# EasyEDA Pro project 无线调试串口.epro

# Schematic schematic1
Create Date: 2024-03-17; Page Name: P1; Project Name: 无线串口; Schematic Name: Schematic1; Update Date: 2024-03-17; Company: 嘉立创EDA; Page Size: A4; Version: V1.0
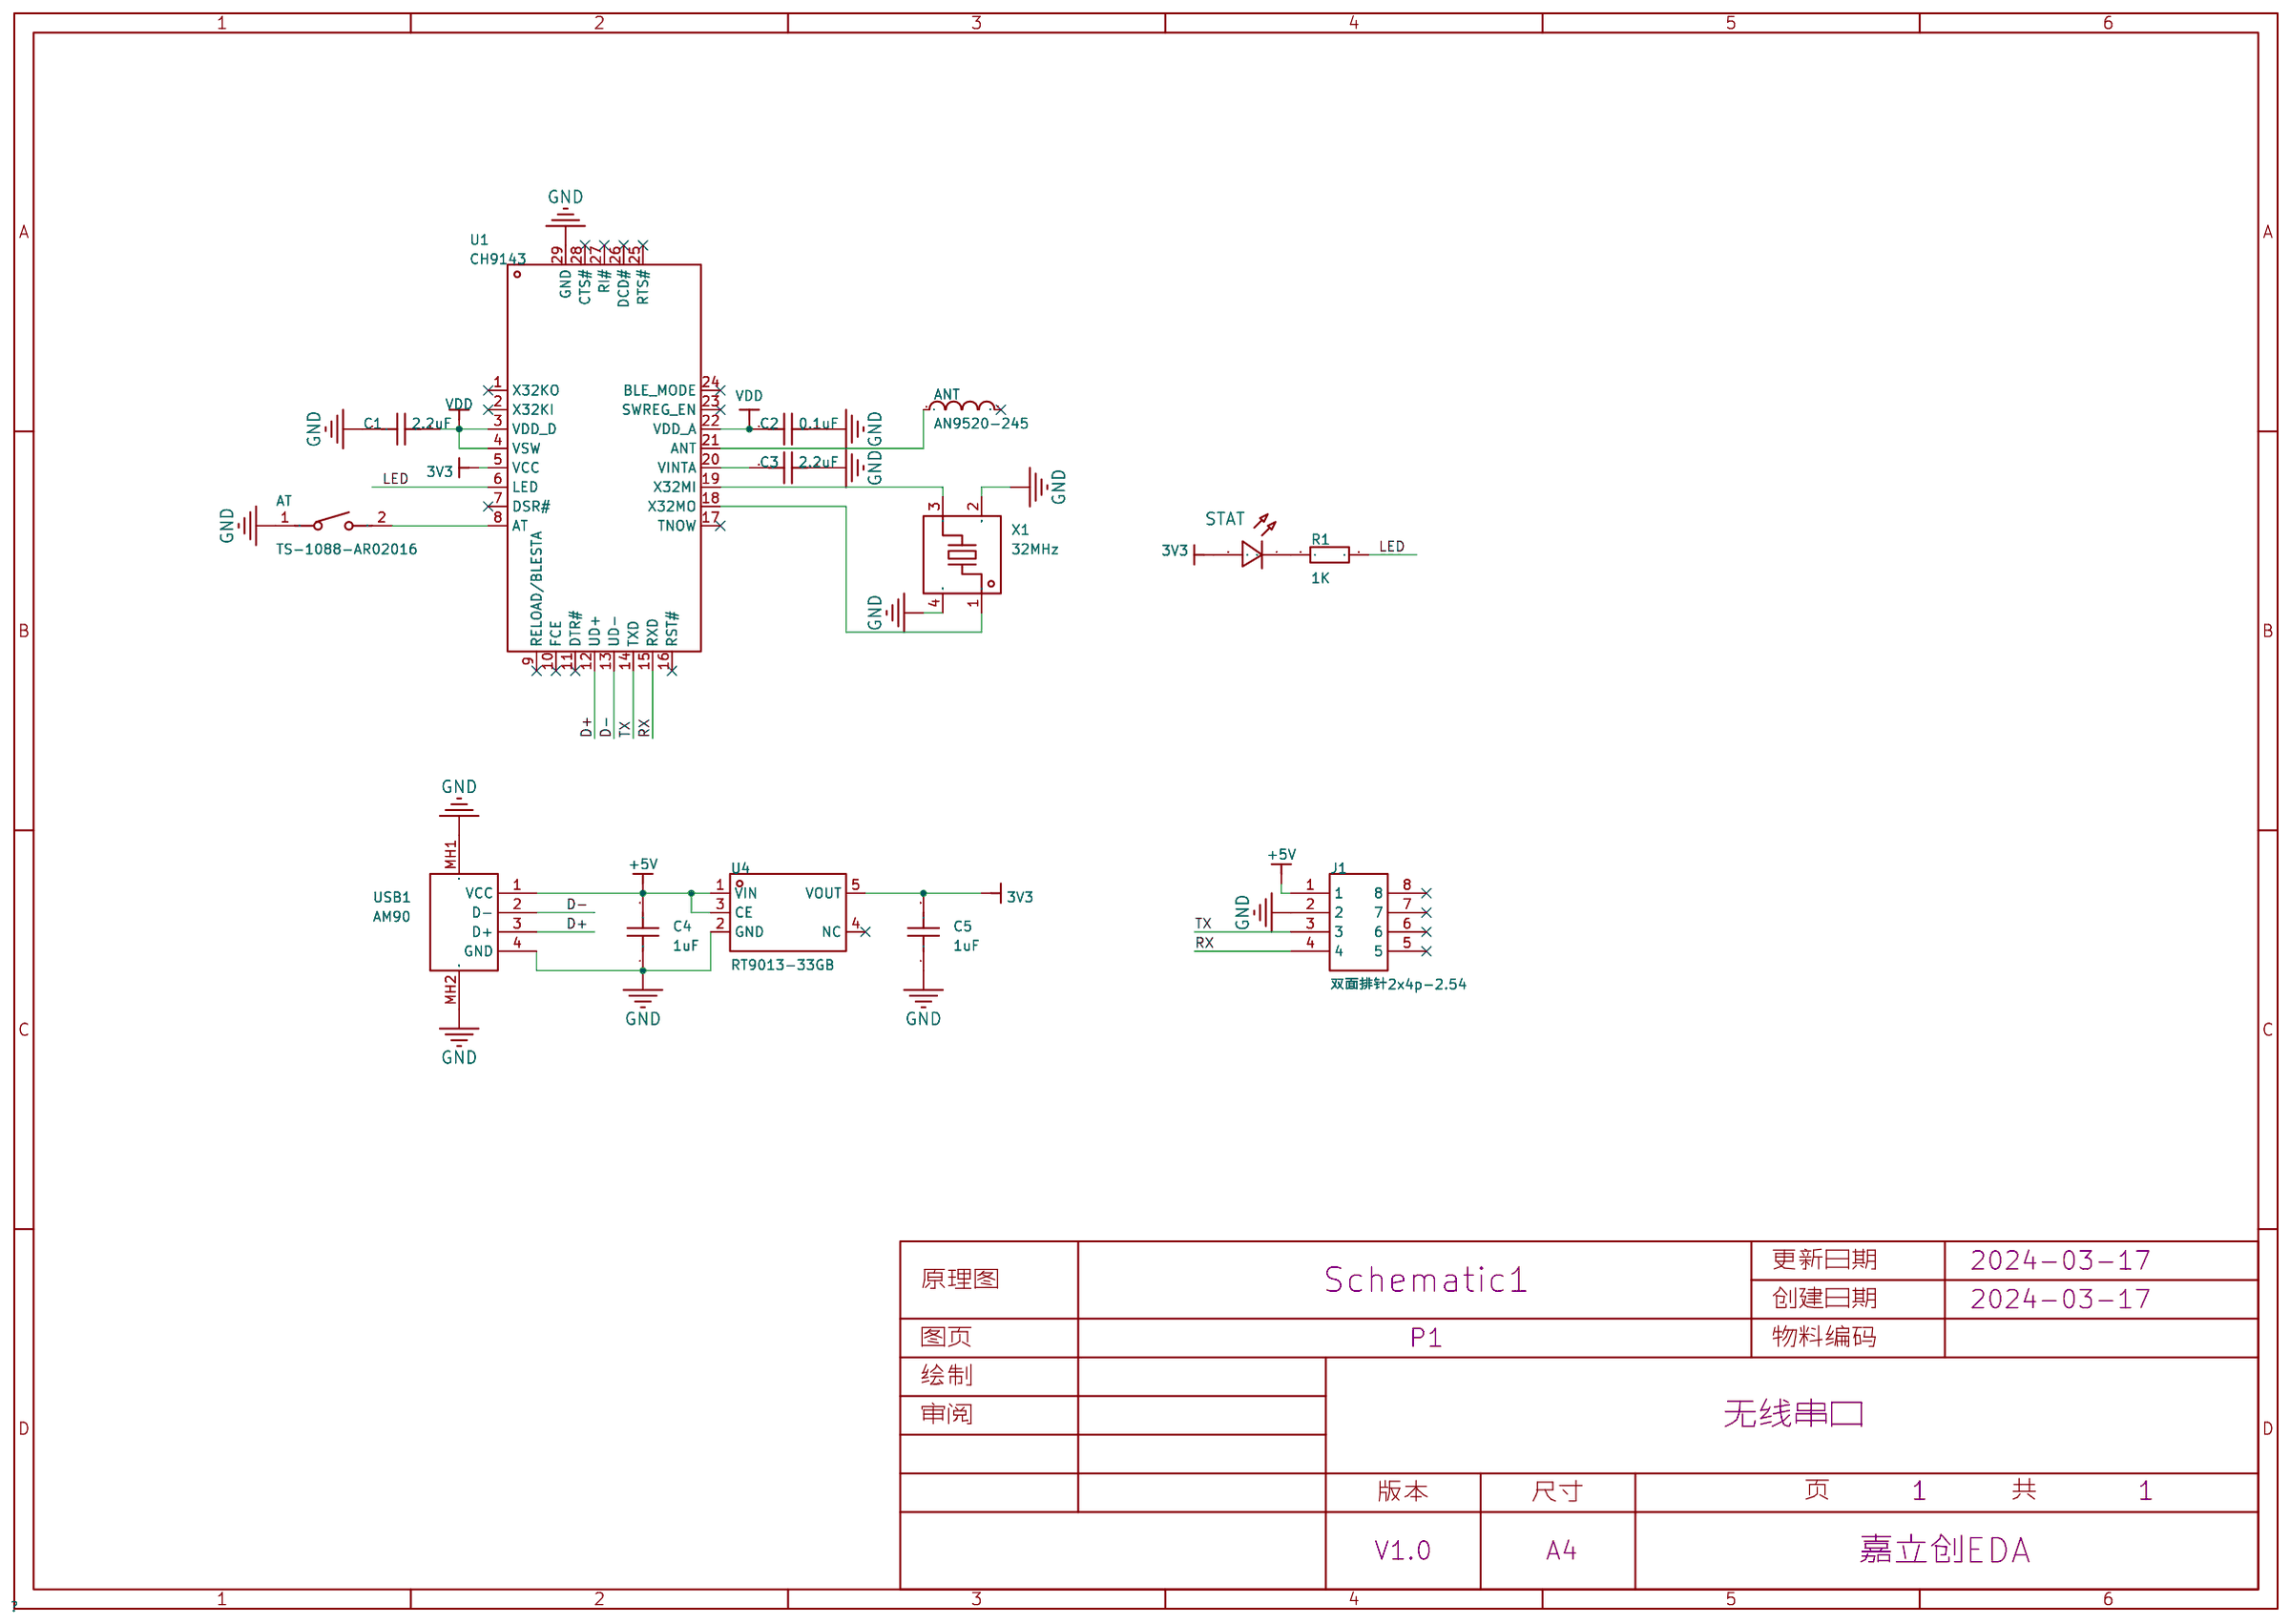
[diagram p0: schematic sheet]

## Parts
ANT  AN9520-245  [ANT-SMD_L9.5-W2.1]
AT  TS-1088-AR02016  [SW-SMD_L3.9-W3.0-P4.45]
C1  2.2uF  [C0603]
C2  0.1uF  [C0603]
C3  2.2uF  [C0603]
C4  1uF  [C0603]
C5  1uF  [C0603]
J1  双面排针2x4p-2.54  [双面排针2x4p-2.54]
R1  1K  [R0603]
STAT  -  [LED_0603]
U1  CH9143  [QFN-28_L4.0-W4.0-P0.40-BL-EP2.7]
U4  RT9013-33GB  [SOT-23-5_L2.9-W1.6-P0.95-LS2.8-BR]
USB1  AM90  [USB-AM-TH_AM90]
X1  32MHz  [CRYSTAL-SMD_4P-L2.0-W1.6-BL]

## Library data of the parts
ANT = AN9520-245: 2.4G陶瓷天线/适用于WIFI蓝牙; Supplier Part: C99665; Manufacturer: rainsun(霖昱微); Supplier Footprint: SMD,2.1x9.5mm; JLCPCB Part Class: 扩展库; Datasheet: https://atta.szlcsc.com/upload/public/pdf/source/20170425/1493115807294.pdf; Supplier: LCSC
AT = TS-1088-AR02016: 电路结构:单刀单掷;按钮形状:圆形按钮;作用力:160gf;安装方式:立贴;开关长度:4mm;开关宽度:3mm;开关高度:2mm;带支架:不带;触点电流:50mA;额定电压(DC):12V;绝缘电阻:100MΩ;机械寿命:10万次;; LCSC Part Name: 4*3*2mm 立贴 轻触开关; Supplier Part: C720477; Manufacturer: XUNPU(讯普); Supplier Footprint: SMD; JLCPCB Part Class: 扩展库; Datasheet: https://atta.szlcsc.com/upload/public/pdf/source/20200810/C720475_60D09DD6C54279ADDB2DC25100F1CC11.pdf; Supplier: LCSC; Circuit: 单刀单掷; Actuator Style: 圆形按钮; Operating Force: 160gf; Mounting Style: 立贴; Switch Length: 4mm; Switch Width: 3mm; Switch Height: 2mm; Strike Gundam: 不带; Contact Current: 50mA; Voltage Rating (DC): 12V; Insulation Resistance: 100MΩ; Actuator/Cap Color: 黑色; Pin Style: SMD接片; Mechanical Life: 10万次; Operating Temperature: -30℃~+80℃
C1-C5 = CAP_0603: Supplier Footprint: 0603
J1 = 双面排针2x4p-2.54
R1 = Res_0603: Supplier Footprint: 0603
STAT = LED_0603-R: Supplier Footprint: 0603
U1 = CH9143: Supplier Part: C2887252; Manufacturer: WCH(南京沁恒); Supplier Footprint: QFN-28-EP(4x4); JLCPCB Part Class: 扩展库; Datasheet: https://atta.szlcsc.com/upload/public/pdf/source/20210823/518548123B20D2A3F85102F56E355BAB.pdf; Supplier: LCSC
U4 = RT9013-33GB_C19268157: Supplier Part: C19268157; Manufacturer: TECH PUBLIC(台舟); Supplier Footprint: SOT-23-5; JLCPCB Part Class: 扩展库; Datasheet: https://atta.szlcsc.com/upload/public/pdf/source/20231201/9D78CA17020D67EC103F1AC7C29CF260.pdf; Supplier: LCSC
USB1 = AM90: 连接器类型:Type-A;标准:USB 2.0;公母:公;端口数量:1;触点数量:4P;安装方式:弯插;额定电流 - 电源:-;工作温度范围:-;; LCSC Part Name: Type-A 公 弯插; Supplier Part: C404965; Manufacturer: SHOU HAN(首韩); Supplier Footprint: 插件; JLCPCB Part Class: 扩展库; Datasheet: https://atta.szlcsc.com/upload/public/pdf/source/20190722/C404965_9CC10BE28E3F9E5134758D030387C529.pdf; Supplier: LCSC; Connector Type: Type-A; Standard: USB 2.0; Gender: 公; Number of Ports: 1; Number of Contacts: 4P; Mounting Style: 弯插
X1 = XL7EL89CKI-111YLC-32M: 晶振类型:贴片晶振;频率:32MHz;常温频差:±10ppm;外接负载电容:8pF;频率稳定度(全温):±20ppm;; LCSC Part Name: 32MHz ±10ppm 8pF; Supplier Part: C2965582; Manufacturer: YXC(扬兴晶振); Supplier Footprint: SMD2016-4P; JLCPCB Part Class: 扩展库; Datasheet: https://atta.szlcsc.com/upload/public/pdf/source/20220805/1793424D7D9A48ECE748A7A37B9248AD.pdf; Supplier: LCSC; Crystal Type: 贴片晶振; Normal temperature Frequency Tolerance: ±10ppm; External load capacitor: 8pF; Frequency Stability(Full temperature range): ±20ppm; Operating Temperature: -40℃~+85℃

## Nets
3V3: C5.2 STAT.2(A) U1.5(VCC) U4.5(VOUT)
+5V: C4.2 J1.1 U4.1(VIN) U4.3(CE) USB1.1(VCC)
GND: AT.1 C1.1 C2.2 C3.1 C4.1 C5.1 J1.2 U1.29(GND) U4.2(GND) USB1.4(GND) USB1.MH1 USB1.MH2 X1.2(GND) X1.4(GND)
VDD: C1.2 C2.1 U1.3(VDD_D) U1.4(VSW) U1.22(VDD_A)
D+: U1.12(UD+) USB1.3(D+)
D-: U1.13(UD-) USB1.2(D-)
LED: R1.2 U1.6(LED)
RX: J1.4 U1.15(RXD)
TX: J1.3 U1.14(TXD)
$1N455: ANT.1 U1.21(ANT)
$1N578: C3.2 U1.20(VINTA)
$1N1055: R1.1 STAT.1(C)
$1N1151: U1.19(X32MI) X1.3
$1N1156: U1.18(X32MO) X1.1
$1N1524: AT.2 U1.8(AT)

Not connected (* = marked no-connect by the designer): ANT 2*; J1 5* 6* 7* 8*; U1 1(X32KO)* 2(X32KI)* 7(DSR#)* 9(RELOAD/BLESTA)* 10(FCE)* 11(DTR#)* 16(RST#)* 17(TNOW)* 23(SWREG_EN)* 24(BLE_MODE)* 25(RTS#)* 26(DCD#)* 27(RI#)* 28(CTS#)*; U4 4(NC)*

# Board PCB1
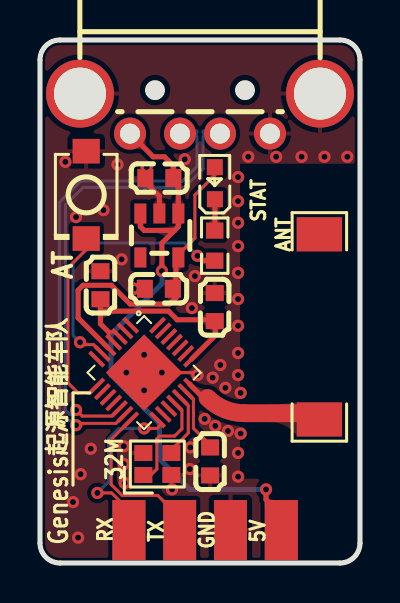
[diagram p1: board, top side]
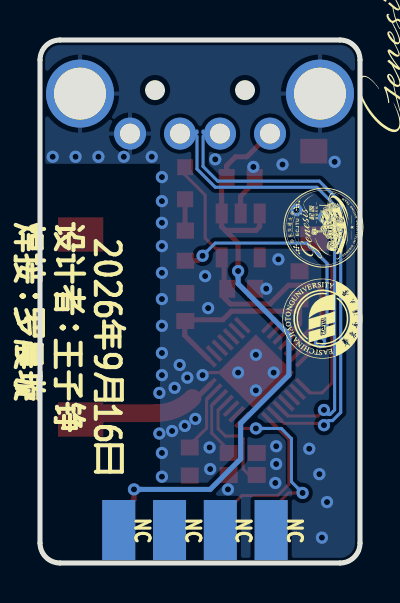
[diagram p2: board, bottom side, seen from below]

Outline 16 x 26.16 mm; copper layers: Top Layer, Bottom Layer. Coordinates in mm from the lower left corner of the outline.
Outline path: 0,25.16 arc(0.29,25.87) 1,26.16 15,26.16 arc(15.71,25.87) 16,25.16 16,1 arc(15.71,0.29) 15,0 1,0 arc(0.29,0.29) 0,1 0,25.16
Stack: Top Layer 0.035mm / Dielectric1 1.51mm FR4 er 4.5 / Bottom Layer 0.035mm

## Design rules (mm)
net D+: DP1
net D-: DP1
spacing copperThickness1oz (default): track to track 0.102, other pairs 0 to 0.3
spacing copperThickness2oz: track to track 0.203, other pairs 0.152 to 0.3
spacing Plane_innerPlane: track to track 0.102, other pairs 0 to 0.3
spacing Copper_copperRegion: track to track 0.102, other pairs 0 to 0.3
track width copperThickness1oz (default): min 0.127, default 0.254, max 2.54
track width copperThickness2oz: min 0.203, default 0.254, max 2.54
differential pair differentialPair (default): width min 0.127, default 0.254, max 2.54; gap min 0.152, default 0.152
pour e132 uses Copper_copperRegion
pour e169 uses Copper_copperRegion

## Placement (name value [footprint] x y rotation side)
ANT  AN9520-245  [ANT-SMD_L9.5-W2.1]  13.97 11.81 90 top
AT  TS-1088-AR02016  [SW-SMD_L3.9-W3.0-P4.45]  2.31 18.42 270 top
C1  2.2uF  [C0603]  3.02 13.89 270 top
C2  0.1uF  [C0603]  8.74 12.8 90 top
C3  2.2uF  [C0603]  8.51 5.08 90 top
C4  1uF  [C0603]  5.97 19.25 0 top
C5  1uF  [C0603]  5.94 13.72 0 top
J1  -  [双面排针2x4p-2.54]  8.25 1.65 270 top
R1  1K  [R0603]  8.74 15.88 270 top
STAT  -  [LED_0603]  8.74 19.05 90 top
U1  CH9143  [QFN-28_L4.0-W4.0-P0.40-BL-EP2.7]  5.21 9.53 225 top
U4  RT9013-33GB  [SOT-23-5_L2.9-W1.6-P0.95-LS2.8-BR]  5.97 16.38 90 top
USB1  AM90  [USB-AM-TH_AM90]  8 22.48 180 top
X1  32MHz  [CRYSTAL-SMD_4P-L2.0-W1.6-BL]  5.87 4.95 0 top

## Footprints (pads in the part's own frame, mm; a bottom-side part is the same pattern mirrored in y, then rotated)
ANT-SMD_L9.5-W2.1
  rect 1.71x2.268 smd: 1(-4.63,0) 2(4.63,0)
C0603
  rect 0.8x0.9 smd: 1(-0.7,0) 2(0.7,0)
CRYSTAL-SMD_4P-L2.0-W1.6-BL
  rect 0.9x0.8 smd: 1(-0.7,-0.55) 2(0.7,-0.55) 3(0.7,0.55) 4(-0.7,0.55)
LED_0603
  rect 0.8x0.8 smd: 1(-0.851,-0.01) 2(0.75,-0.005)
QFN-28_L4.0-W4.0-P0.40-BL-EP2.7
  rect 0.2x1 smd: 1(-1.2,-2.15) 2(-0.8,-2.15) 3(-0.4,-2.15) 4(-0.001,-2.15) 5(0.4,-2.15) 6(0.8,-2.15) 7(1.2,-2.15) 15(1.2,2.15) 16(0.8,2.15) 17(0.4,2.15) 18(0,2.15) 19(-0.4,2.15) 20(-0.8,2.15) 21(-1.2,2.15)
  rect 1x0.2 smd: 8(2.15,-1.2) 9(2.15,-0.8) 10(2.15,-0.4) 11(2.15,0) 12(2.15,0.4) 13(2.15,0.8) 14(2.15,1.2) 22(-2.15,1.2) 23(-2.15,0.8) 24(-2.15,0.4) 25(-2.15,0) 26(-2.15,-0.4) 27(-2.15,-0.8) 28(-2.15,-1.2)
  rect 2.7x2.7 smd: 29(0.001,0)
R0603
  rect 0.806x0.864 smd: 1(-0.753,0) 2(0.753,0)
SOT-23-5_L2.9-W1.6-P0.95-LS2.8-BR
  rect 1x0.6 smd: 1(1.1,-0.95) 2(1.1,0) 3(1.1,0.95) 4(-1.1,0.95) 5(-1.1,-0.95)
SW-SMD_L3.9-W3.0-P4.45
  rect 1.23x1.36 smd: 1(-2.185,0) 2(2.185,0)
USB-AM-TH_AM90
  round 1.6 hole 1: 1(3.5,1) 2(1,1) 3(-1,1) 4(-3.5,1)
  round 3.4 hole 2.6: MH1(6,-1) MH2(-6,-1)
双面排针2x4p-2.54
  rect 3x1.65 smd: 1(0,3.81) 2(0,1.27) 3(0,-1.27) 4(0,-3.81)
  rect 3x1.65 smd far side: 5(0,-3.81) 6(0,-1.27) 7(0,1.27) 8(0,3.81)

## Nets
As in the schematic.

Pads without a net: ANT 2; J1 5 6 7 8; U1 1 2 7 9 10 11 16 17 23 24 25 26 27 28; U4 4

## Via types
v1: diameter 0.61, hole 0.305, Top Layer to Bottom Layer, 57 vias

## Routing (per net, layer and track width the routed paths; a pad name or vN(x,y) marks a point on that pad's centre or on a via; arc(x,y) is an arc through that point)
3V3: length 16
  Top Layer w0.152: U4.5 6.92,15.43 7.75,16.26 7.75,18.41 8.78,19.44
  Top Layer w0.254: U1.5 1.91,12.26 1.91,13.64 2.16,13.89 3.57,13.89 4.51,12.95 6.48,12.95 6.8,13.27 6.8,15.16 U4.5
+5V: length 30.8
  Top Layer w0.254: J1.1 12.06,2.41 11.3,3.17 v1(11.3,3.68) ; U4.3 5.02,16.83 5.21,16.64 6.73,16.64 ; v1(6.1,14.61) 6.1,16 6.73,16.64 ; 6.73,16.64 6.92,16.83 U4.1 6.92,18.8 6.67,19.05 6.67,19.87 6.22,20.32 5.66,20.32 4.5,21.48
  Bottom Layer w0.254: v1(6.1,14.61) 6.1,13.97 3.56,11.43 3.56,9.4 5.97,6.98 5.97,5.21 7.49,3.68 v1(11.3,3.68)
GND: length 4.6
  Top Layer w0.152: U1.29 v1(6.1,9.53) 7.75,9.53 v1(7.87,9.4)
  Top Layer w0.254: 5.27,19.05 5.97,18.35 5.97,17.48
  vias: v1(1.27,20.07) v1(1.65,3.05) v1(1.8,17.3) v1(1.91,1.27) v1(2.03,4.45) v1(2.54,5.72) v1(3.18,17.65) v1(3.88,19.93) v1(4.08,15.19) v1(4.19,5.84) v1(4.19,4.95) v1(4.23,4.01) v1(4.32,9.53) v1(4.69,13.72) v1(5.21,10.41) v1(5.21,8.64) v1(5.33,19.81) v1(6.6,3.68) v1(7.24,20.19) v1(7.52,5.78) v1(7.49,4.7) v1(7.59,12.75) v1(7.75,14.35) v1(8.23,7.21) v1(8.64,9.27) v1(8.76,6.86) v1(9.02,9.91) v1(9.27,8.76) v1(9.4,6.6) v1(9.91,19.3) v1(9.91,18.1) v1(9.91,17.02) v1(9.91,15.85) v1(9.91,14.52) v1(9.91,13.2) v1(9.91,11.87) v1(9.91,10.5) v1(9.91,9.4) v1(9.91,5.51) v1(9.91,4.32) v1(10.03,8.51) v1(10.03,6.48) v1(10.41,20.32) v1(11.81,20.32) v1(13.08,20.32) v1(14.22,20.32) v1(15.37,20.32)
VDD: length 11.7
  Top Layer w0.152: 3.79,10.94 3.43,11.3 3.43,11.56 3.74,11.56 4.08,11.22
  Top Layer w0.254: 3.43,11.56 3.02,11.96 3.02,12.57 ; U1.22 8.76,11.38 8.76,12.08 C2.1 8.67,12.17 6.86,12.17 6.43,12.6 3.05,12.6 3.02,12.57 ; C1.2 3.02,12.57
D+: length 23.6
  Top Layer w0.152: v1(1.8,7.66) 2.11,7.35 3.6,7.35 3.97,7.72
  Bottom Layer w0.152: 8.15,21.35 8.15,19.71 7.24,18.8 2.16,18.8 1.27,17.91 1.27,7.66 1.5,7.43 1.57,7.43 v1(1.8,7.66) ; 8.15,21.61 8.15,21.53 8.21,21.48 USB1.3
D-: length 24.4
  Top Layer w0.152: v1(1.8,6.89) 1.89,6.98 3.8,6.98 U1.13
  Bottom Layer w0.152: 7.85,21.35 7.85,19.84 7.11,19.1 2.03,19.1 0.97,18.03 0.97,7.53 1.37,7.12 1.57,7.12 v1(1.8,6.89) ; USB1.2 7.79,21.48 7.85,21.53 7.85,21.61
LED: length 13.5
  Top Layer w0.152: 3.23,10.37 2.68,10.92 2.12,10.92 v1(2,11.04)
  Top Layer w0.254: 8.74,15.12 8.12,15.12 v1(7.87,15.37)
  Bottom Layer w0.152: v1(7.87,15.37) 7.24,16 2.67,16 1.65,14.99 1.65,11.39 v1(2,11.04)
RX: length 9.3
  Top Layer w0.152: v1(2.87,3.51) 3.58,3.51 4.44,2.64 J1.4 ; v1(5.21,6.73) 5.86,6.73 6.08,6.95 5.77,7.26
  Bottom Layer w0.152: v1(5.21,6.73) 3.94,6.73 3.43,6.22 3.43,4.06 v1(2.87,3.51)
TX: length 8.5
  Top Layer w0.152: J1.3 6.99,2.29 5.89,3.38 4.11,3.38 3.56,3.93 3.56,6.18 4.64,7.26
$1N455: length 7.1
  Top Layer w0.254: 8.38,8.26 8.17,8.26 7.47,8.96
  Top Layer w0.889: ANT.1 13.95,7.2 arc(13.63,7.42) 13.24,7.49 10.22,7.49 arc(9.23,7.69) 8.38,8.26
$1N578: length 3.3
  Top Layer w0.152: 8.51,5.91 7.67,6.75 7.67,8.19 7.19,8.68
$1N1055: length 1.6
  Top Layer w0.254: R1.1 8.75,16.64 8.75,18.2
$1N1151: length 3.3
  Top Layer w0.152: 6.54,5.63 7.42,6.51 7.42,7.88 6.9,8.39
$1N1156: length 5.4
  Top Layer w0.152: 5.17,4.4 5.55,4.4 5.85,4.7 5.85,6 5.84,6 5.84,6.22 5.98,6.35 6.73,6.35 7.1,6.72 7.1,7.64 6.62,8.11
$1N1524: length 9.2
  Top Layer w0.152: 2.94,8.96 2.49,8.51 1.91,8.51 1.4,9.02 1.4,14.76 2.35,15.72 2.54,15.72

## Copper pours and planes (outline as drawn; the poured copper is in the pictures)
GND on Top Layer: 17.65,-1.4 -1.14,-1.4 -1.14,28.83 17.65,28.83
GND on Bottom Layer: 17.45,-1.97 -1.34,-1.97 -1.34,28.26 17.45,28.26

Small or netless copper shapes (teardrops, artwork), in the pictures only: 49 on Top Layer, 8 on Bottom Layer

## Text on the board
Bottom Solder Mask Layer: USB-BLE-UART
Bottom Silkscreen Layer: NC | 2026年9月16日 / 设计者：王子铮 / 焊接：罗晨璇
Top Silkscreen Layer: RX | TX | GND | 5V | 32M | Genesis起源智能车队
